# Altium schematic sheet 100_AC-DC.SchDoc: AC-DC Converter
size A4; Date: xxxxxx; Author: R.Ducuara; DrawnBy: J.Jaramillo; Revision: R1V0; SheetNumber: 2; SheetTotal: 7
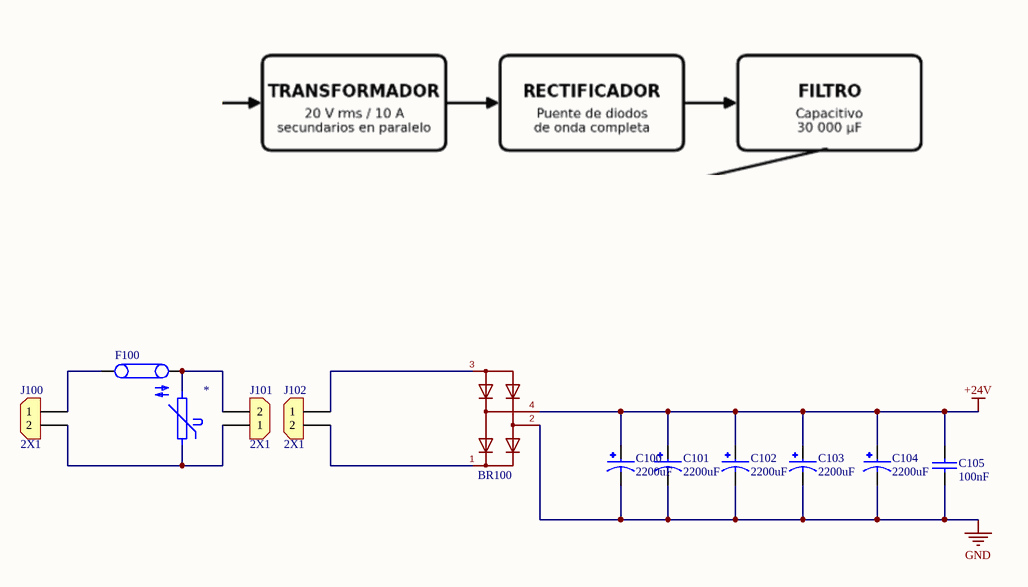
[diagram p0: 100_AC-DC.SchDoc]

## Parts
*  RV_Varistor_300VAC_125J_D14  [RV_Varistor_300VAC_125J_D14]  (value not drawn)
BR100  1000V 25A  [D_Bridge_1000V_25A_KBPC_FP]  (value not drawn)
C100  value 2200uF  [C_Alum_2200uF_50V_D18]  (hidden comment: C_Alum_2200uF_50V_D18)
C101  value 2200uF  [C_Alum_2200uF_50V_D18]  (hidden comment: C_Alum_2200uF_50V_D18)
C102  value 2200uF  [C_Alum_2200uF_50V_D18]  (hidden comment: C_Alum_2200uF_50V_D18)
C103  value 2200uF  [C_Alum_2200uF_50V_D18]  (hidden comment: C_Alum_2200uF_50V_D18)
C104  value 2200uF  [C_Alum_2200uF_50V_D18]  (hidden comment: C_Alum_2200uF_50V_D18)
C105  value 100nF  [1206]  (hidden comment: 100nF 100V)
F100  500V 10A  [FUSE_HLD_CARTRIDGE_5x20mm]  (value not drawn)
J100  2X1  [CON_2X1_TH_5MM_BAT]
J101  2X1  [CON_2X1_TH_5MM_BAT]
J102  2X1  [CON_2X1_TH_5MM_BAT]

## Nets
+24V: BR100.4(Input_~) C100.P C101.P C102.P C103.P C104.P C105.1
GND: BR100.2(Input_~) C100.N C101.N C102.N C103.N C104.N C105.2
Net*_1: *.1 J100.2 J101.1
Net*_2: *.2 F100.2 J101.2
NetBR100_1: BR100.1(+) J102.2
NetBR100_3: BR100.3(-) J102.1
NetF100_1: F100.1 J100.1

## Notes on the sheet
- Title:
- Project:
- File:
- Revision:
- Date:
- Size:
- A4
- Drawn by:

## Library data of the parts
* = RV_Varistor_300VAC_125J_D14: 470 V 6 kA Varistor 1 Circuitos Orificio pasante Tipo moneda 14mm; Manufacturer: TDK; Manufacturer Part Number: B72214P2301K101; Reel Sotck: N/A; Last modified by: R.Ducuara; Last modified date: 20261120
BR100 = D_Bridge_1000V_25A_KBPC_FP: Rectificador de puente Single Phase Estándar 1 kV Montaje de chasis KBPC FP; Manufacturer: Diotec Semiconductor; Manufacturer Part Number: KBPC10/15/2510FP; Supplier 1: Digikey; Supplier Part Number 1: 4878-KBPC10/15/2510FP-ND; Reel Stock: N/A; Last modified by: R.Ducuara; Last modified date: 20261120
C100-C104 = C_Alum_2200uF_50V_D18: Capacitores electrolíticos de aluminio 2200 µF 50 V Radial, encapsulado 2000 h a 105°C; Manufacturer: Panasonic Industry; Manufacturer Part Number: EEU-HD1H222; Supplier 1: Digi-Key; Supplier Part Number 1: P15152-ND; Last modified by: R.Ducuara; Last modified date: 20261120
C105 = Cap_0.1uF_1206_100V: CAP CER 0.1UF 100V X7R 1206; Manufacturer: Samsung Electro-Mechanics; Manufacturer Part Number: CL31B104KCFNNNE; Supplier 1: Digi-Key; Supplier Part Number 1: 1276-1151-1-ND; Last modified by: J.Jaramillo; Last modified date: 20240309; ComponentLink1Description: Digi-Key; ComponentLink1URL: https://www.digikey.com/en/products/detail/samsung-electro-mechanics/CL31B104KCFNNNE/3886809
F100 = F_HLD_CARTRIDGE_5x20mm: FUSE BLOK CARTRIDGE 500V 10A PCB; Manufacturer: Schurter Inc.; Manufacturer Part Number: 0031.8201; Supplier 1: Digi-Key; Supplier Part Number 1: 486-1258-ND; Reel Sotck: N/A; Last modified by: J.Jaramillo; Last modified date: 20240309; ComponentLink1Description: Digi-Key; ComponentLink1URL: https://www.digikey.com/en/products/detail/schurter-inc/0031-8201/669925?s=N4IgTCBcDaIAxwMwEYB0AOMdkgLoF8g
J100-J102 = Con_2x1_TH_5mm_Battery: Power Connectors ROHS; Manufacturer: Changzhou Amass Elec; Manufacturer Part Number: XT30U-M; Supplier 1: LCSC; Supplier Part Number 1: C99101; Reel Stock: N/A; Last modified by: J.Jaramillo; Last modified date: 20240310; ComponentLink1Description: Digi-Key; ComponentLink1URL: https://lcsc.com/product-detail/Power-Connectors_Changzhou-Amass-Elec-XT30U-M_C99101.html